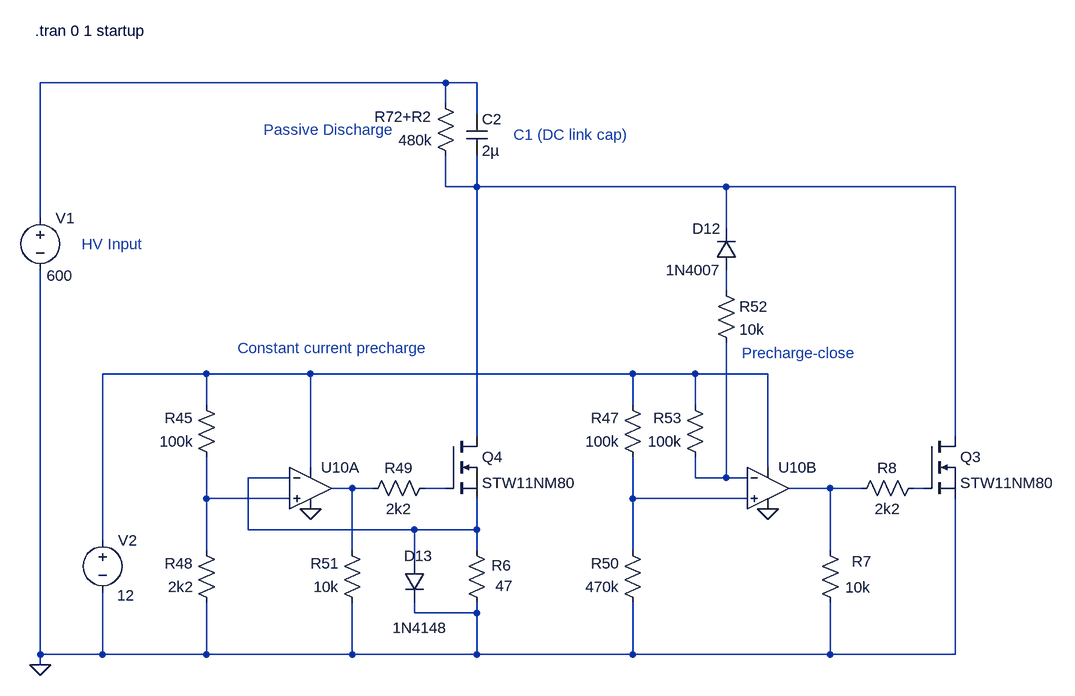
[diagram p0: schematic DCDCv9-3r_precharge.asc]
DCDCv9-3r_precharge.asc, the LTspice schematic file:
Version 4
SHEET 1 1588 1588
WIRE 352 608 -272 608
WIRE 400 608 352 608
WIRE 352 640 352 608
WIRE 400 656 400 608
WIRE 352 768 352 720
WIRE 400 768 400 720
WIRE 400 768 352 768
WIRE 784 768 400 768
WIRE 1136 768 784 768
WIRE -272 816 -272 608
WIRE 784 832 784 768
WIRE 784 928 784 896
WIRE -16 1056 -176 1056
WIRE 144 1056 -16 1056
WIRE 640 1056 144 1056
WIRE 736 1056 640 1056
WIRE 848 1056 736 1056
WIRE -16 1104 -16 1056
WIRE 640 1104 640 1056
WIRE 736 1104 736 1056
WIRE 400 1152 400 768
WIRE 1136 1152 1136 768
WIRE 144 1200 144 1056
WIRE 848 1200 848 1056
WIRE 112 1216 48 1216
WIRE 736 1216 736 1184
WIRE 784 1216 784 1008
WIRE 784 1216 736 1216
WIRE 816 1216 784 1216
WIRE 208 1232 176 1232
WIRE 240 1232 208 1232
WIRE 352 1232 320 1232
WIRE 944 1232 880 1232
WIRE 992 1232 944 1232
WIRE 1088 1232 1072 1232
WIRE -16 1248 -16 1184
WIRE 112 1248 -16 1248
WIRE 640 1248 640 1184
WIRE 816 1248 640 1248
WIRE 48 1296 48 1216
WIRE 304 1296 48 1296
WIRE 400 1296 400 1248
WIRE 400 1296 304 1296
WIRE -176 1312 -176 1056
WIRE -16 1328 -16 1248
WIRE 208 1328 208 1232
WIRE 400 1328 400 1296
WIRE 640 1328 640 1248
WIRE 944 1328 944 1232
WIRE 304 1344 304 1296
WIRE 304 1424 304 1408
WIRE 400 1424 400 1408
WIRE 400 1424 304 1424
WIRE -272 1488 -272 896
WIRE -176 1488 -176 1392
WIRE -176 1488 -272 1488
WIRE -16 1488 -16 1408
WIRE -16 1488 -176 1488
WIRE 208 1488 208 1408
WIRE 208 1488 -16 1488
WIRE 400 1488 400 1424
WIRE 400 1488 208 1488
WIRE 640 1488 640 1408
WIRE 640 1488 400 1488
WIRE 944 1488 944 1408
WIRE 944 1488 640 1488
WIRE 1136 1488 1136 1248
WIRE 1136 1488 944 1488
WIRE -272 1504 -272 1488
FLAG -272 1504 0
FLAG 848 1264 0
FLAG 144 1264 0
SYMBOL voltage -176 1296 R0
WINDOW 3 22 101 Left 2
SYMATTR Value 12
SYMATTR InstName V2
SYMATTR SpiceLine Rser=0.1
SYMBOL voltage -272 800 R0
WINDOW 3 10 105 Left 2
SYMATTR Value 600
SYMATTR InstName V1
SYMATTR SpiceLine Rser=0.1
SYMBOL res 0 1200 R180
WINDOW 0 36 76 Left 2
WINDOW 3 36 40 Left 2
SYMATTR InstName R45
SYMATTR Value 100k
SYMBOL cap 384 656 R0
SYMATTR InstName C2
SYMATTR Value 2µ
SYMBOL res 416 1424 R180
WINDOW 0 -37 73 Left 2
WINDOW 3 -40 42 Left 2
SYMATTR InstName R6
SYMATTR Value 47
SYMBOL res 368 736 R180
WINDOW 0 36 76 Left 2
WINDOW 3 36 40 Left 2
SYMATTR InstName R72+R2
SYMATTR Value 480k
SYMBOL res 0 1424 R180
WINDOW 0 36 76 Left 2
WINDOW 3 36 40 Left 2
SYMATTR InstName R48
SYMATTR Value 2k2
SYMBOL Res 336 1216 R90
WINDOW 0 0 56 VBottom 2
WINDOW 3 32 56 VTop 2
SYMATTR InstName R49
SYMATTR Value 2k2
SYMBOL Res 768 912 R0
SYMATTR InstName R52
SYMATTR Value 10k
SYMBOL diode 288 1344 R0
WINDOW 0 0 -8 Left 2
WINDOW 3 -18 103 Left 2
SYMATTR InstName D13
SYMATTR Value 1N4148
SYMBOL nmos 1088 1152 R0
SYMATTR InstName Q3
SYMATTR Value STW11NM80
SYMBOL nmos 352 1152 R0
SYMATTR InstName Q4
SYMATTR Value STW11NM80
SYMBOL res 656 1200 R180
WINDOW 0 36 76 Left 2
WINDOW 3 36 40 Left 2
SYMATTR InstName R47
SYMATTR Value 100k
SYMBOL Res 1088 1216 R90
WINDOW 0 0 56 VBottom 2
WINDOW 3 32 56 VTop 2
SYMATTR InstName R8
SYMATTR Value 2k2
SYMBOL diode 800 896 R180
WINDOW 0 24 64 Left 2
WINDOW 3 24 0 Left 2
SYMATTR InstName D12
SYMATTR Value 1N4007
SYMBOL Res 752 1200 R180
WINDOW 0 36 76 Left 2
WINDOW 3 36 40 Left 2
SYMATTR InstName R53
SYMATTR Value 100k
SYMBOL res 656 1424 R180
WINDOW 0 36 76 Left 2
WINDOW 3 36 40 Left 2
SYMATTR InstName R50
SYMATTR Value 470k
SYMBOL res 960 1424 R180
WINDOW 0 -48 79 Left 2
WINDOW 3 -46 39 Left 2
SYMATTR InstName R7
SYMATTR Value 10k
SYMBOL OpAmps/UniversalOpAmp2 144 1232 R0
SYMATTR InstName U10A
SYMBOL OpAmps/UniversalOpAmp2 848 1232 R0
SYMATTR InstName U10B
SYMBOL res 224 1424 R180
WINDOW 0 36 76 Left 2
WINDOW 3 36 40 Left 2
SYMATTR InstName R51
SYMATTR Value 10k
TEXT -280 528 Left 2 !.tran 0 1 startup
TEXT 456 688 Left 2 ;C1 (DC link cap)
TEXT 72 680 Left 2 ;Passive Discharge
TEXT 32 1016 Left 2 ;Constant current precharge
TEXT 808 1024 Left 2 ;Precharge-close
TEXT -208 856 Left 2 ;HV Input

The netlist it stands for:
* DCDCv9-3r_precharge.asc
V2 N004 0 12 Rser=0.1
V1 N001 0 600 Rser=0.1
R45 N011 N004 100k
C2 N001 N002 2µ
R6 0 N005 47
R72+R2 N002 N001 480k
R48 0 N011 2k2
R49 N008 N007 2k2
R52 N003 N006 10k
D13 N005 0 1N4148
M§Q3 N002 N010 0 0 STW11NM80
M§Q4 N002 N008 N005 N005 STW11NM80
R47 N012 N004 100k
R8 N010 N009 2k2
D12 N003 N002 1N4007
R53 N006 N004 100k
R50 0 N012 470k
R7 0 N009 10k
XU10A N011 N005 N004 0 N007 level2 Avol=1Meg GBW=10Meg Slew=10Meg Ilimit=25m Rail=0 Vos=0 En=0 Enk=0 In=0 Ink=0 Rin=500Meg  ; pins In+ In- V+ V- OUT
XU10B N012 N006 N004 0 N009 level2 Avol=1Meg GBW=10Meg Slew=10Meg Ilimit=25m Rail=0 Vos=0 En=0 Enk=0 In=0 Ink=0 Rin=500Meg  ; pins In+ In- V+ V- OUT
R51 0 N007 10k
.model D D
.lib standard.dio
.model NMOS NMOS
.model PMOS PMOS
.lib standard.mos
.tran 0 1 startup
* C1 (DC link cap)
* Passive Discharge
* Constant current precharge
* Precharge-close
* HV Input
.lib UniversalOpAmp2.lib
.backanno
.end